# Altium schematic sheet RP2040_Schem.SchDoc
size A; SheetNumber: 2; SheetTotal: 2
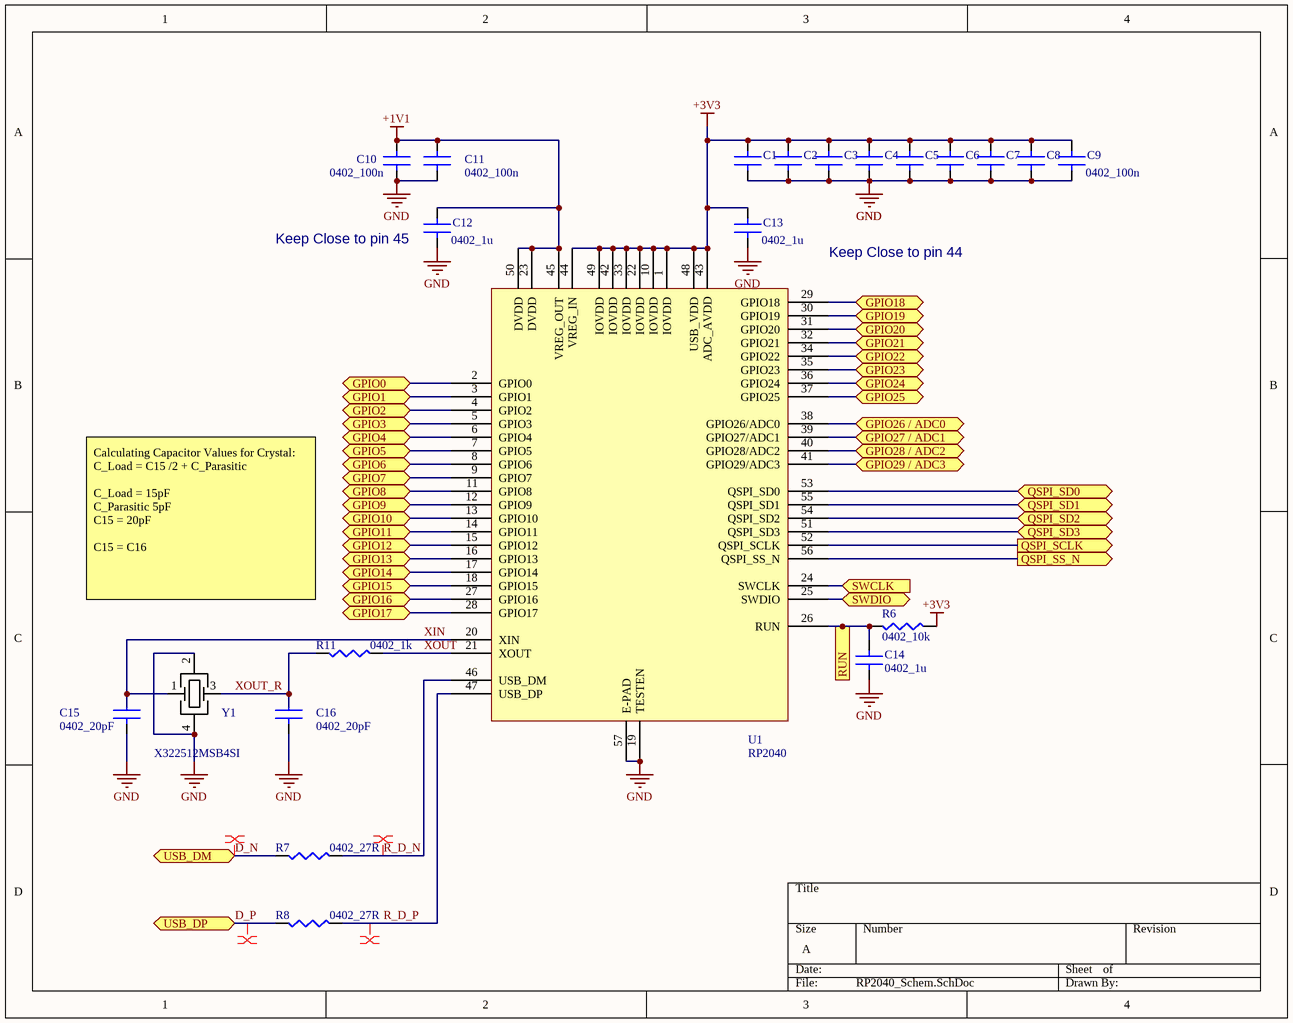
[diagram p0: RP2040_Schem.SchDoc]

## Parts
C1  0402_100n  [0402]
C2  0402_100n  [0402]  (value not drawn)
C3  0402_100n  [0402]  (value not drawn)
C4  0402_100n  [0402]  (value not drawn)
C5  0402_100n  [0402]  (value not drawn)
C6  0402_100n  [0402]  (value not drawn)
C7  0402_100n  [0402]  (value not drawn)
C8  0402_100n  [0402]  (value not drawn)
C9  0402_100n  [0402]  (value not drawn)
C10  0402_100n  [0402]
C11  0402_100n  [0402]
C12  0402_1u  [0402]
C13  0402_1u  [0402]
C14  0402_1u  [0402]
C15  0402_20pF  [0402]
C16  0402_20pF  [0402]
R6  0402_10k  [0402]
R7  0402_27R  [0402]
R8  0402_27R  [0402]
R11  0402_1k  [0402]
U1  RP2040  [QFN56]
Y1  X322512MSB4SI  [3225_Crystal]

## Ports
GPIO0 (bidir), GPIO1 (bidir), GPIO2 (bidir), GPIO3 (bidir), GPIO4 (bidir), GPIO5 (bidir), GPIO6 (bidir), GPIO7 (bidir), GPIO8 (bidir), GPIO9 (bidir), GPIO10 (bidir), GPIO11 (bidir), GPIO12 (bidir), GPIO13 (bidir), GPIO14 (bidir), GPIO15 (bidir), GPIO16 (bidir), GPIO17 (bidir), GPIO18 (bidir), GPIO19 (bidir), GPIO20 (bidir), GPIO21 (bidir), GPIO22 (bidir), GPIO23 (bidir), GPIO24 (bidir), GPIO25 (bidir), GPIO26 / ADC0 (bidir), GPIO27 / ADC1 (bidir), GPIO28 / ADC2 (bidir), GPIO29 / ADC3 (bidir), QSPI_SCLK (out), QSPI_SD0 (bidir), QSPI_SD1 (bidir), QSPI_SD2 (bidir), QSPI_SD3 (bidir), QSPI_SS_N (out), RUN (in), SWCLK (in), SWDIO (bidir), USB_DM (bidir), USB_DP (bidir)

## Nets
+1V1: C10.2 C11.2 C12.2 U1.23(DVDD) U1.45(VREG_OUT) U1.50(DVDD)
+3V3: C1.2 C2.2 C3.2 C4.2 C5.2 C6.2 C7.2 C8.2 C9.2 C13.2 R6.2 U1.1(IOVDD) U1.10(IOVDD) U1.22(IOVDD) U1.33(IOVDD) U1.42(IOVDD) U1.43(ADC_AVDD) U1.44(VREG_IN) U1.48(USB_VDD) U1.49(IOVDD)
GND: C1.1 C2.1 C3.1 C4.1 C5.1 C6.1 C7.1 C8.1 C9.1 C10.1 C11.1 C12.1 C13.1 C14.1 C15.1 C16.1 U1.19(TESTEN) U1.57(E-PAD) Y1.2 Y1.4
D_N: R7.1 ; port USB_DM
D_P: R8.1 ; port USB_DP
GPIO0: U1.2(GPIO0) ; port GPIO0
GPIO1: U1.3(GPIO1) ; port GPIO1
GPIO2: U1.4(GPIO2) ; port GPIO2
GPIO3: U1.5(GPIO3) ; port GPIO3
GPIO4: U1.6(GPIO4) ; port GPIO4
GPIO5: U1.7(GPIO5) ; port GPIO5
GPIO6: U1.8(GPIO6) ; port GPIO6
GPIO7: U1.9(GPIO7) ; port GPIO7
GPIO8: U1.11(GPIO8) ; port GPIO8
GPIO9: U1.12(GPIO9) ; port GPIO9
GPIO10: U1.13(GPIO10) ; port GPIO10
GPIO11: U1.14(GPIO11) ; port GPIO11
GPIO12: U1.15(GPIO12) ; port GPIO12
GPIO13: U1.16(GPIO13) ; port GPIO13
GPIO14: U1.17(GPIO14) ; port GPIO14
GPIO15: U1.18(GPIO15) ; port GPIO15
GPIO16: U1.27(GPIO16) ; port GPIO16
GPIO17: U1.28(GPIO17) ; port GPIO17
GPIO18: U1.29(GPIO18) ; port GPIO18
GPIO19: U1.30(GPIO19) ; port GPIO19
GPIO20: U1.31(GPIO20) ; port GPIO20
GPIO21: U1.32(GPIO21) ; port GPIO21
GPIO22: U1.34(GPIO22) ; port GPIO22
GPIO23: U1.35(GPIO23) ; port GPIO23
GPIO24: U1.36(GPIO24) ; port GPIO24
GPIO25: U1.37(GPIO25) ; port GPIO25
GPIO26 / ADC0: U1.38(GPIO26/ADC0) ; port GPIO26 / ADC0
GPIO27 / ADC1: U1.39(GPIO27/ADC1) ; port GPIO27 / ADC1
GPIO28 / ADC2: U1.40(GPIO28/ADC2) ; port GPIO28 / ADC2
GPIO29 / ADC3: U1.41(GPIO29/ADC3) ; port GPIO29 / ADC3
QSPI_SCLK: U1.52(QSPI_SCLK) ; port QSPI_SCLK
QSPI_SD0: U1.53(QSPI_SD0) ; port QSPI_SD0
QSPI_SD1: U1.55(QSPI_SD1) ; port QSPI_SD1
QSPI_SD2: U1.54(QSPI_SD2) ; port QSPI_SD2
QSPI_SD3: U1.51(QSPI_SD3) ; port QSPI_SD3
QSPI_SS_N: U1.56(QSPI_SS_N) ; port QSPI_SS_N
R_D_N: R7.2 U1.46(USB_DM)
R_D_P: R8.2 U1.47(USB_DP)
RUN: C14.2 R6.1 U1.26(RUN) ; port RUN
SWCLK: U1.24(SWCLK) ; port SWCLK
SWDIO: U1.25(SWDIO) ; port SWDIO
XIN: C15.2 U1.20(XIN) Y1.1
XOUT: R11.2 U1.21(XOUT)
XOUT_R: C16.2 R11.1 Y1.3

## Layout directives
differential pair: D_N, D_P, R_D_N, R_D_P

## Notes on the sheet
- (near C12) Keep Close to pin 45
- Keep Close to pin 44
- Calculating Capacitor Values for Crystal:
  C_Load = C15 /2 + C_Parasitic
  C_Load = 15pF
  C_Parasitic 5pF
  C15 = 20pF
  C15 = C16

## Library data of the parts
C1-C16 = 0402 Capacitor
R6-R8 R11 = 0402 Resistor
U1 = RP2040: Manufacturer: Raspberry Pi; Supplier 1: Rs; Manufacturer Part Number: RP2040; RoHS: No; Category: Uncategorized; Stock 1: 6500; Pricing 1: 500=0.721, 2500=0.703, 5000=0.692 (GBP); Supplier Part Number 1: 2211610
Y1 = 3225_Crystal: CRYSTAL 12MHz 20pF SMD